# Altium project GTV4.0_Board.PrjPcb (part 8 of 11)

## Sheet Temperature_Sense_Section.SchDoc
size 420 x 297 mm; DocumentNumber: 15; SheetNumber: 15; SheetTotal: 17
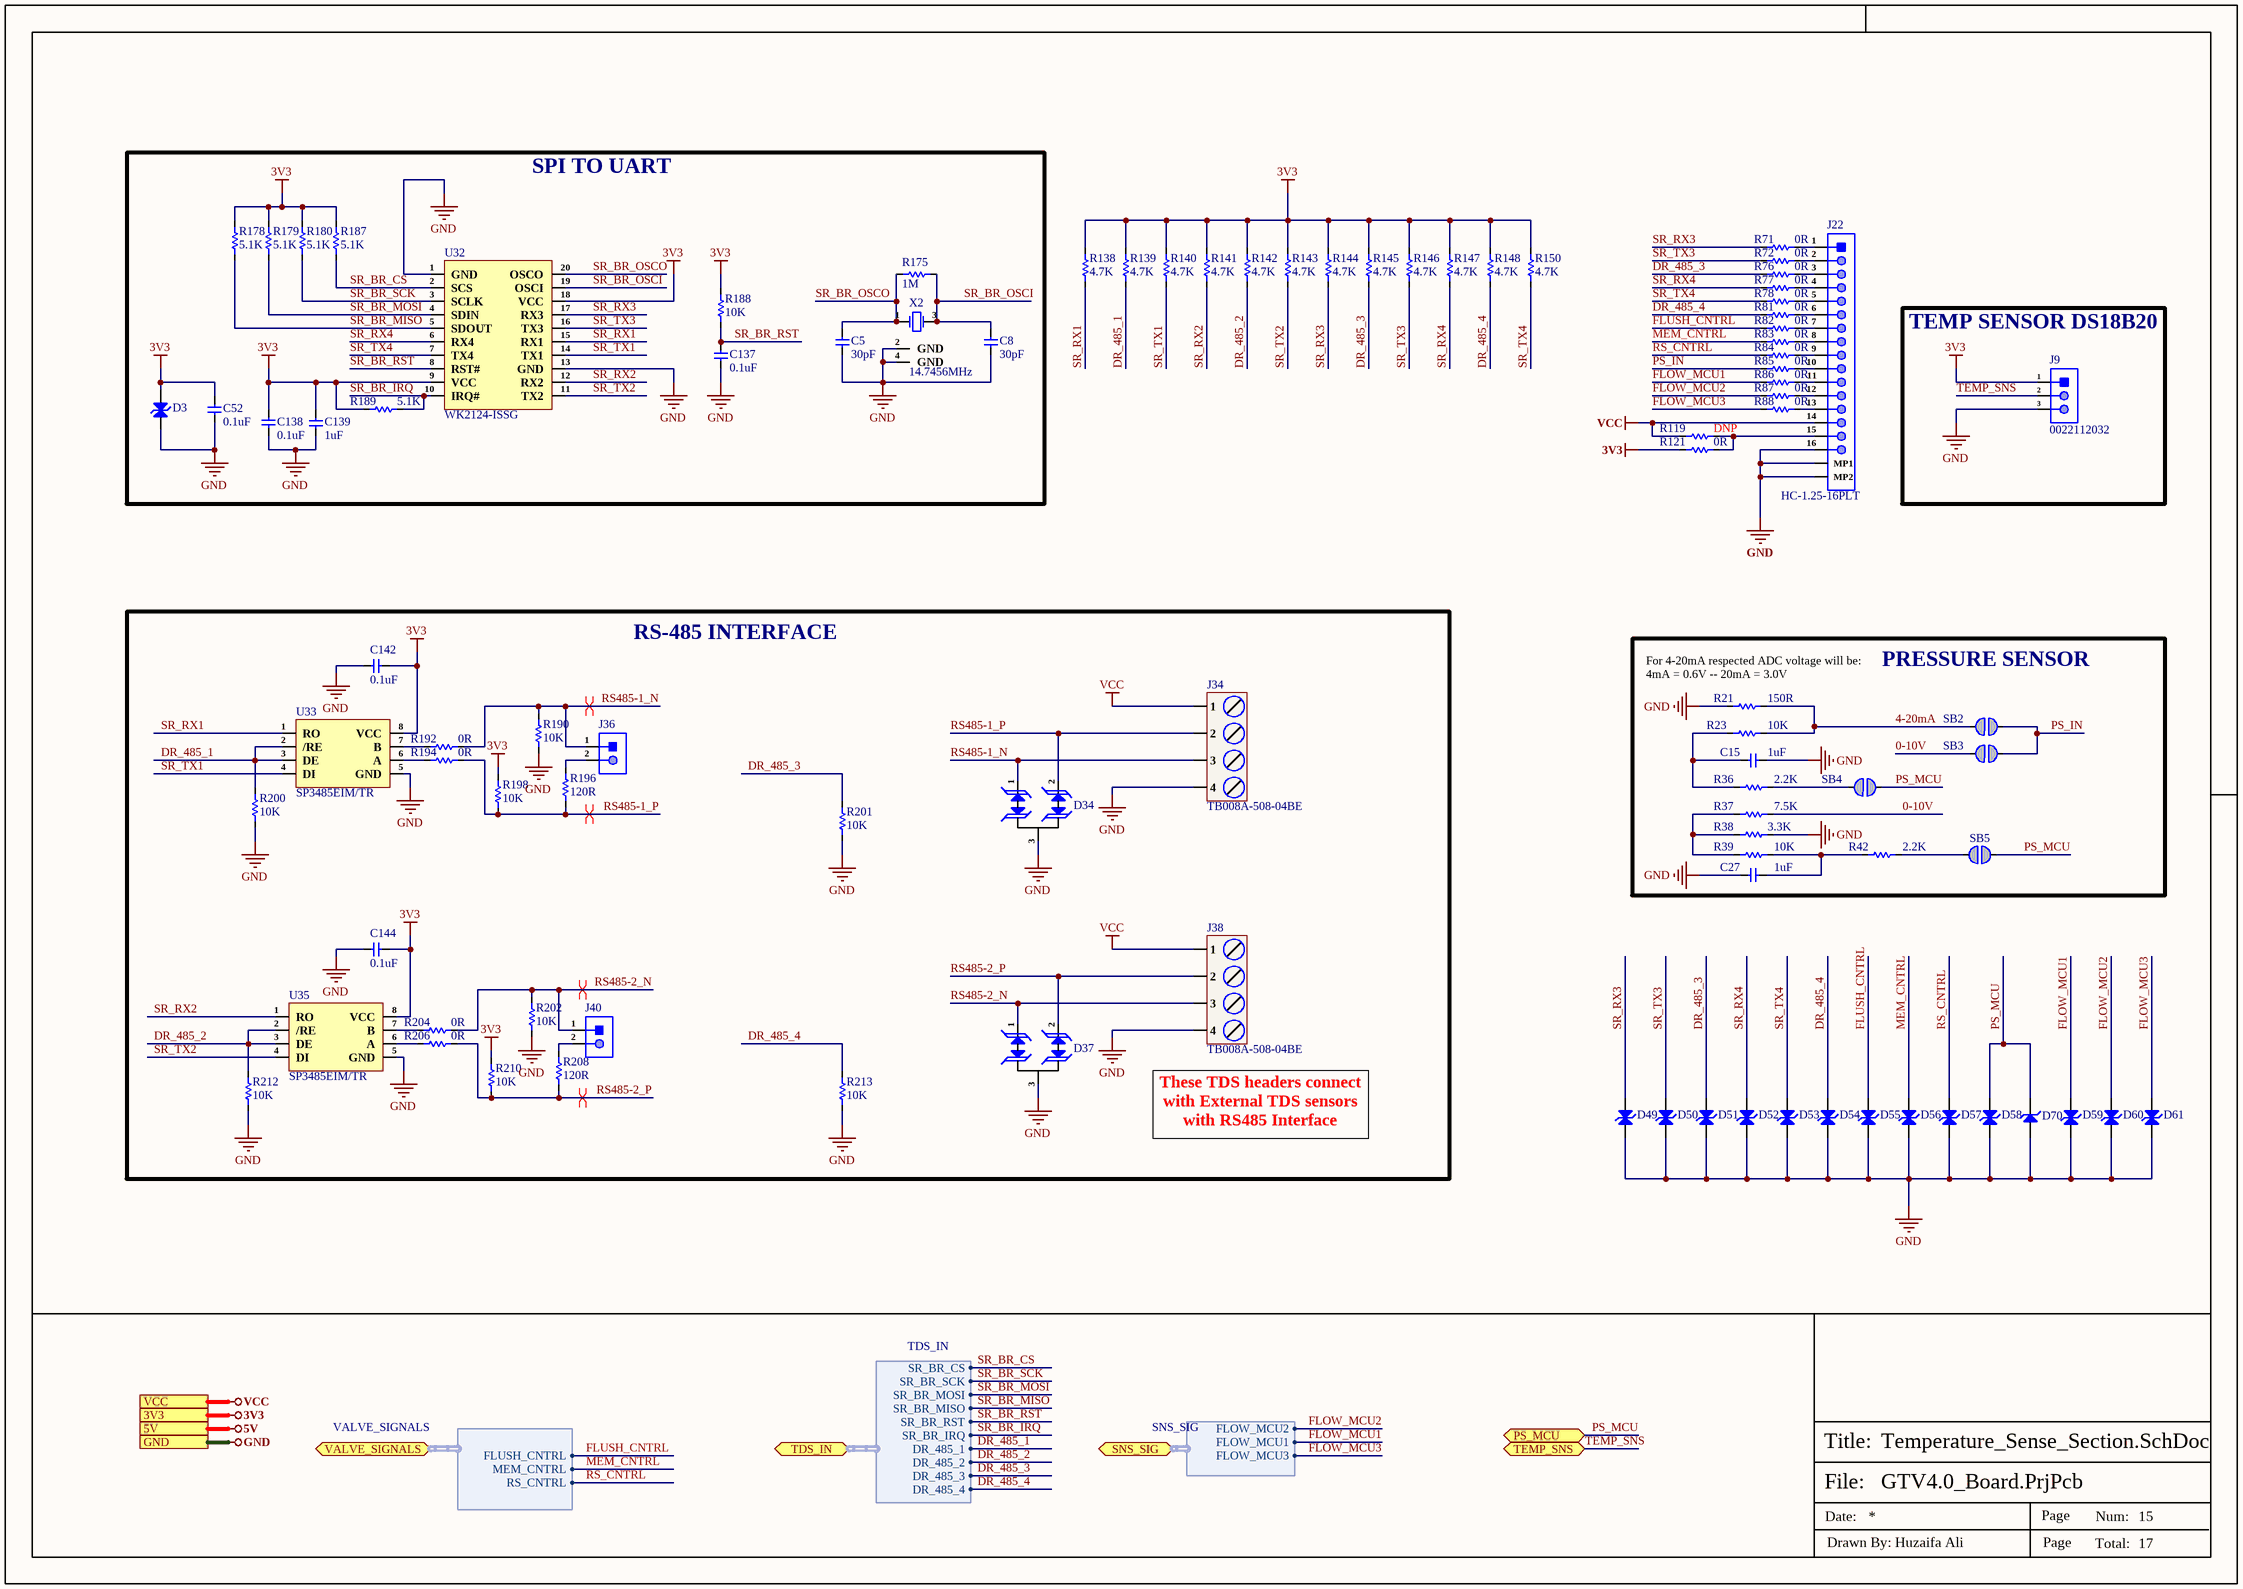
[diagram p13: Temperature_Sense_Section.SchDoc]

### Parts
C5  30pF  [Cap-0402]
C8  30pF  [Cap-0402]
C15  1uF  [Cap-0603]
C27  1uF  [Cap-0603]
C52  0.1uF  [Cap-0603]
C137  0.1uF  [Cap-0402]
C138  0.1uF  [Cap-0402]
C139  1uF  [Cap-0402]
C142  0.1uF  [Cap-0402]
C144  0.1uF  [Cap-0402]
D3  SMAJ5.0CA  [SMA Bi Directional]  (value not drawn)
D34  SM712  [SOT-23]  (value not drawn)
D37  SM712  [SOT-23]  (value not drawn)
D49  LESD8D3.3CAT5G  [SOD-882 Bi Directional]  (value not drawn)
D50  LESD8D3.3CAT5G  [SOD-882 Bi Directional]  (value not drawn)
D51  LESD8D3.3CAT5G  [SOD-882 Bi Directional]  (value not drawn)
D52  LESD8D3.3CAT5G  [SOD-882 Bi Directional]  (value not drawn)
D53  LESD8D3.3CAT5G  [SOD-882 Bi Directional]  (value not drawn)
D54  LESD8D3.3CAT5G  [SOD-882 Bi Directional]  (value not drawn)
D55  LESD8D3.3CAT5G  [SOD-882 Bi Directional]  (value not drawn)
D56  LESD8D3.3CAT5G  [SOD-882 Bi Directional]  (value not drawn)
D57  LESD8D3.3CAT5G  [SOD-882 Bi Directional]  (value not drawn)
D58  LESD8D3.3CAT5G  [SOD-882 Bi Directional]  (value not drawn)
D59  LESD8D3.3CAT5G  [SOD-882 Bi Directional]  (value not drawn)
D60  LESD8D3.3CAT5G  [SOD-882 Bi Directional]  (value not drawn)
D61  LESD8D3.3CAT5G  [SOD-882 Bi Directional]  (value not drawn)
D70  MM3Z3V3B  [SOD323F]  (value not drawn)
J9  0022112032  [0022112032]
J22  HC-1.25-16PLT  [HC-1.25-16PLT]
J34  TB008A-508-04BE  [TB008A-508-04BE]
J36  X6511WV-02H-C60D30  [HDR1X2_]  (value not drawn)
J38  TB008A-508-04BE  [TB008A-508-04BE]
J40  X6511WV-02H-C60D30  [HDR1X2_]  (value not drawn)
R21  150R  [Res-0603]
R23  10K  [Res-0603]
R36  2.2K  [Res-0603]
R37  7.5K  [Res-0603]
R38  3.3K  [Res-0603]
R39  10K  [Res-0603]
R42  2.2K  [Res-0603]
R71  0R  [Res-0603]
R72  0R  [Res-0603]
R76  0R  [Res-0603]
R77  0R  [Res-0603]
R78  0R  [Res-0603]
R81  0R  [Res-0603]
R82  0R  [Res-0603]
R83  0R  [Res-0603]
R84  0R  [Res-0603]
R85  0R  [Res-0603]
R86  0R  [Res-0603]
R87  0R  [Res-0603]
R88  0R  [Res-0603]
R119  DNP  [Res-1206]
R121  0R  [Res-1206]
R138  4.7K  [Res-0402]
R139  4.7K  [Res-0402]
R140  4.7K  [Res-0402]
R141  4.7K  [Res-0402]
R142  4.7K  [Res-0402]
R143  4.7K  [Res-0402]
R144  4.7K  [Res-0402]
R145  4.7K  [Res-0402]
R146  4.7K  [Res-0402]
R147  4.7K  [Res-0402]
R148  4.7K  [Res-0402]
R150  4.7K  [Res-0402]
R175  1M  [Res-0402]
R178  5.1K  [Res-0402]
R179  5.1K  [Res-0402]
R180  5.1K  [Res-0402]
R187  5.1K  [Res-0402]
R188  10K  [Res-0402]
R189  5.1K  [Res-0402]
R190  10K  [Res-0402]
R192  0R  [Res-0402]
R194  0R  [Res-0402]
R196  120R  [Res-0603]
R198  10K  [Res-0402]
R200  10K  [Res-0402]
R201  10K  [Res-0402]
R202  10K  [Res-0402]
R204  0R  [Res-0402]
R206  0R  [Res-0402]
R208  120R  [Res-0603]
R210  10K  [Res-0402]
R212  10K  [Res-0402]
R213  10K  [Res-0402]
SB2  Solder Bridge 0603  [Solder Bridge]  (value not drawn)  (no BOM)
SB3  Solder Bridge 0603  [Solder Bridge]  (value not drawn)  (no BOM)
SB4  Solder Bridge 0603  [Solder Bridge]  (value not drawn)  (no BOM)
SB5  Solder Bridge 0603  [Solder Bridge]  (value not drawn)  (no BOM)
U32  WK2124-ISSG  [SSOP-20-208mil]
U33  SP3485EIM/TR  [SOP-8]
U35  SP3485EIM/TR  [SOP-8]
X2  14.7456MHz  [SMD3225-4P]

### Blocks framed on the sheet
SPI TO UART: C5 C8 C52 C137-C139 D3 R175 R178-R180 R187-R189 U32 X2
TEMP SENSOR DS18B20: J9
RS-485 INTERFACE: C142 C144 D34 D37 J34 J36 J38 J40 R190 R192 R194 R196 R198 R200-R202 R204 R206 R208 R210 R212 R213 U33 U35
PRESSURE SENSOR: C15 C27 R21 R23 R36-R39 R42 SB2-SB5

### Ports
3V3, 5V, GND, PS_MCU (bidir), SNS_SIG (bidir, harness SNS_SIG), TDS_IN (bidir, harness TDS_IN), TEMP_SNS (bidir), VALVE_SIGNALS (bidir, harness VALVE_SIGNALS), VCC

### Harnesses
TDS_IN: SR_BR_RST, SR_BR_IRQ, DR_485_1, DR_485_2, SR_BR_CS, SR_BR_SCK, SR_BR_MOSI, SR_BR_MISO, DR_485_3, DR_485_4
SNS_SIG: FLOW_MCU1, FLOW_MCU2, FLOW_MCU3
VALVE_SIGNALS: FLUSH_CNTRL, MEM_CNTRL, RS_CNTRL

### Nets
3V3: C52.2 C138.1 C139.2 C142.2 C144.2 D3.2(K) J9.1 R121.1 R138.2 R139.2 R140.2 R141.2 R142.2 R143.2 R144.2 R145.2 R146.2 R147.2 R148.2 R150.2 R178.2 R179.2 R180.2 R187.2 R188.2 R189.2 R198.1 R210.1 U32.9(VCC) U32.18(VCC) U33.8(VCC) U35.8(VCC) ; port 3V3
GND: C5.1 C8.1 C15.2 C27.1 C52.1 C137.1 C138.2 C139.1 C142.1 C144.1 D3.1(A) D34.3(GND) D37.3(GND) D49.1(A) D50.1(A) D51.1(A) D52.1(A) D53.1(A) D54.1(A) D55.1(A) D56.1(A) D57.1(A) D58.1(A) D59.1(A) D60.1(A) D61.1(A) D70.1(A) J9.3 J22.16 J22.MP1 J22.MP2 J34.4 J38.4 R21.1 R38.2 R190.2 R200.2 R201.2 R202.2 R212.2 R213.2 U32.1(GND) U32.13(GND) U33.5(GND) U35.5(GND) X2.2(GND) X2.4(GND) ; port GND
VCC: J22.14 J34.1 J38.1 R119.1 ; port VCC
0-10V: R37.2 SB3.2
4-20mA: R21.2 R23.2 SB2.2
DR_485_1: R139.1 R200.1 U33.2(/RE) U33.3(DE) ; port TDS_IN.DR_485_1
DR_485_2: R142.1 R212.1 U35.2(/RE) U35.3(DE) ; port TDS_IN.DR_485_2
DR_485_3: D51.2(A) R76.1 R145.1 R201.1 ; port TDS_IN.DR_485_3
DR_485_4: D54.2(A) R81.1 R148.1 R213.1 ; port TDS_IN.DR_485_4
FLOW_MCU1: D59.2(A) R86.1 ; port SNS_SIG.FLOW_MCU1
FLOW_MCU2: D60.2(A) R87.1 ; port SNS_SIG.FLOW_MCU2
FLOW_MCU3: D61.2(A) R88.1 ; port SNS_SIG.FLOW_MCU3
FLUSH_CNTRL: D55.2(A) R82.1 ; port VALVE_SIGNALS.FLUSH_CNTRL
MEM_CNTRL: D56.2(A) R83.1 ; port VALVE_SIGNALS.MEM_CNTRL
PS_IN: R85.1 SB2.1 SB3.1
PS_MCU: D58.2(A) D70.2(K) SB4.1 SB5.1 ; port PS_MCU
RS485-1_N: D34.1(I/O1) J34.3 J36.1 R190.1 R192.2
RS485-1_P: D34.2(I/O2) J34.2 R194.2 R196.1 R198.2
RS485-2_N: D37.1(I/O1) J38.3 J40.1 R202.1 R204.2
RS485-2_P: D37.2(I/O2) J38.2 R206.2 R208.1 R210.2
RS_CNTRL: D57.2(A) R84.1 ; port VALVE_SIGNALS.RS_CNTRL
SR_BR_CS: R187.1 U32.2(SCS) ; port TDS_IN.SR_BR_CS
SR_BR_IRQ: R189.1 U32.10(IRQ#) ; port TDS_IN.SR_BR_IRQ
SR_BR_MISO: R178.1 U32.5(SDOUT) ; port TDS_IN.SR_BR_MISO
SR_BR_MOSI: R179.1 U32.4(SDIN) ; port TDS_IN.SR_BR_MOSI
SR_BR_OSCI: C8.2 R175.2 U32.19(OSCI) X2.3(OSC2)
SR_BR_OSCO: C5.2 R175.1 U32.20(OSCO) X2.1(OSC1)
SR_BR_RST: C137.2 R188.1 U32.8(RST#) ; port TDS_IN.SR_BR_RST
SR_BR_SCK: R180.1 U32.3(SCLK) ; port TDS_IN.SR_BR_SCK
SR_RX1: R138.1 U32.15(RX1) U33.1(RO)
SR_RX2: R141.1 U32.12(RX2) U35.1(RO)
SR_RX3: D49.2(A) R71.1 R144.1 U32.17(RX3)
SR_RX4: D52.2(A) R77.1 R147.1 U32.6(RX4)
SR_TX1: R140.1 U32.14(TX1) U33.4(DI)
SR_TX2: R143.1 U32.11(TX2) U35.4(DI)
SR_TX3: D50.2(A) R72.1 R146.1 U32.16(TX3)
SR_TX4: D53.2(A) R78.1 R150.1 U32.7(TX4)
TEMP_SNS: J9.2 ; port TEMP_SNS
NetC15_1: C15.1 R23.1 R36.1
NetC27_2: C27.2 R39.2 R42.1
NetJ22_1: J22.1 R71.2
NetJ22_2: J22.2 R72.2
NetJ22_3: J22.3 R76.2
NetJ22_4: J22.4 R77.2
NetJ22_5: J22.5 R78.2
NetJ22_6: J22.6 R81.2
NetJ22_7: J22.7 R82.2
NetJ22_8: J22.8 R83.2
NetJ22_9: J22.9 R84.2
NetJ22_10: J22.10 R85.2
NetJ22_11: J22.11 R86.2
NetJ22_12: J22.12 R87.2
NetJ22_13: J22.13 R88.2
NetJ22_15: J22.15 R119.2 R121.2
NetJ36_2: J36.2 R196.2
NetJ40_2: J40.2 R208.2
NetR36_2: R36.2 SB4.2
NetR37_1: R37.1 R38.1 R39.1
NetR42_2: R42.2 SB5.2
NetR192_1: R192.1 U33.7(B)
NetR194_1: R194.1 U33.6(A)
NetR204_1: R204.1 U35.7(B)
NetR206_1: R206.1 U35.6(A)

### Layout directives
differential pair: RS485-1_N, RS485-1_P, RS485-2_N, RS485-2_P

### Notes on the sheet
- (near R21) For 4-20mA respected ADC voltage will be:
  4mA = 0.6V -- 20mA = 3.0V
- (near J38) These TDS headers connect with External TDS sensors with RS485 Interface
- File:
- Title:
- Date:
- Page
- Num:
- Total:
- Drawn By: Huzaifa Ali

### Library data of the parts
C5 C8 = CC0402GRNPO9BN300: CAP CER 30PF 50V C0G/NPO 0402; Manufacturer: Yageo; Item Type: Capacitor; Tolerance: 2%; Dielectric: C0G; Supplier: Digikey; LCSC Part Number: C277479; Manufacturer Part Number: CC0402GRNPO9BN300; RoHS: Yes; Stock: 114930; Pricing: 1=0.1, 10=0.052, 50=0.0296, 100=0.023, 500=0.01728, 1000=0.01358, 2500=0.01235, 5000=0.01136 (USD); Mounting Technology: Surface Mount; Case/Package: 0402; Case Code (Imperial): 0402; Case Code (Metric): 1005; Weight: 2.3E-05oz; Min Operating Temperature: -55°C; Max Operating Temperature: 125°C; Value: 30pF; Voltage Rating (DC): 50V; Packaging: Tape and Reel; Termination: SMD/SMT; Voltage Rating: 50V; Series: CC; Length: 0.039inch; Width: 0.02inch; Thickness: 0.022inch; Halogen Free: 5694HalogenFree; Lead Free: 5697LeadFree; ComponentLink1URL: https://datasheet.ciiva.com/13263/upy-gp-np0-16v-to-50v-8-3714-13263350.pdf?src-supplier=Mouser; ComponentLink1Description: https://datasheet.ciiva.com/13263/upy-gp-np0-16v-to-50v-8-3714-13263350.pdf?src-supplier=Mouser
C15 C27 = CC0603KRX5R8BB105: CAP CER 1UF 25V X5R 0603; Manufacturer: Yageo; Tolerance: 10%; Item Type: Capacitor; Supplier 1: Digi-Key; Manufacturer Part Number: CC0603KRX5R8BB105; RoHS: Yes; Category: Ceramic Capacitors; Stock 1: 919939; Pricing 1: 1=0.12000, 10=0.08400, 50=0.04760, 100=0.03940, 500=0.02764, 1000=0.02288 (USD); Mount: Surface Mount; Case/Package: 0603; Number of Pins: 2; Case Code (Metric): 1608; Case Code (Imperial): 0603; Min Operating Temperature: -55°C; Max Operating Temperature: 85°C; Capacitance: 1uF; Dielectric: X5R; Package Quantity: 1; Voltage Rating: 25V; Packaging: Tape and Reel; Termination: SMD/SMT; Voltage Rating (DC): 25V; Series: CC; Construction: Flat; Length: 1.6mm; Width: 0.031inch; Height: 0.8mm; Thickness: 0.035inch; Depth: 0.8mm; Radiation Hardening: No; REACH SVHC: No SVHC; Lead Free: Lead Free; Halogen Free: Halogen Free; RoHS Compliant: Yes; ComponentLink1URL: https://datasheet.ciiva.com/176/mlccorderingcode-176785.pdf?src-supplier=Digi-Key; ComponentLink1Description: https://datasheet.ciiva.com/176/mlccorderingcode-176785.pdf?src-supplier=Digi-Key; ComponentLink2URL: https://datasheet.ciiva.com/176/mlccorderingcode-176786.pdf?src-supplier=Digi-Key; ComponentLink2Description: https://datasheet.ciiva.com/176/mlccorderingcode-176786.pdf?src-supplier=Digi-Key; ComponentLink3URL: https://datasheet.ciiva.com/176/mlccorderingcode-176787.pdf?src-supplier=Digi-Key; ComponentLink3Description: https://datasheet.ciiva.com/176/mlccorderingcode-176787.pdf?src-supplier=Digi-Key; ComponentLink4URL: https://datasheet.ciiva.com/17436/upy-gphc-x5r-4v-to-50v-12-17436952.pdf?src-supplier=Avnet+Europe; ComponentLink4Description: https://datasheet.ciiva.com/17436/upy-gphc-x5r-4v-to-50v-12-17436952.pdf?src-supplier=Avnet+Europe; ComponentLink5URL: https://datasheet.ciiva.com/7978/1525783-7978171.pdf?src-supplier=Element14; ComponentLink5Description: https://datasheet.ciiva.com/7978/1525783-7978171.pdf?src-supplier=Element14; ComponentLink6URL: https://datasheet.ciiva.com/11586/upy-gphc-x5r-4v-to-50v-12-11586318.pdf?src-supplier=Avnet; ComponentLink6Description: https://datasheet.ciiva.com/11586/upy-gphc-x5r-4v-to-50v-12-11586318.pdf?src-supplier=Avnet; Supplier Part Number 1: 311-1445-1-ND; LCSC Part Number: C14664
C52 = CC0603ZRY5V9BB104: as C69 on sheet WIFI_Display_Sheet; Supplier 1: Digi-Key; Manufacturer Part Number: CC0603ZRY5V9BB104; Stock 1: 15000880; Pricing 1: 1=0.1, 10=0.075, 100=0.0334, 500=0.02386, 1000=0.01874 (USD); Mount: Surface Mount; Case/Package: 0603; Number of Pins: 2; Case Code (Metric): 1608; Case Code (Imperial): 0603; Min Operating Temperature: -30°C; Max Operating Temperature: 85°C; Dielectric: Y5V; Voltage Rating: 50V; Package Quantity: 1; Packaging: Tape and Reel; Voltage Rating (DC): 50V; Termination: SMD/SMT; Composition: Ceramic; Voltage: 50V; Length: 1.6mm; Height: 0.8mm; Width: 0.031inch; Thickness: 0.035inch; Depth: 0.8mm; Radiation Hardening: No; REACH SVHC: No SVHC; Lead Free: Lead Free; Halogen Free: Halogen Free; ComponentLink1URL: http://www.yageo.com/documents/recent/UPY-GPHC_Y5V_6.3V-to-50V_8.pdf?src-supplier=Digi-Key; ComponentLink1Description: http://www.yageo.com/documents/recent/UPY-GPHC_Y5V_6.3V-to-50V_8.pdf?src-supplier=Digi-Key; ComponentLink2URL: http://www.yageo.com/documents/recent/UPY-GPHC_Y5V_6.3V-to-50V_5.pdf?src-supplier=Avnet+Europe; ComponentLink2Description: http://www.yageo.com/documents/recent/UPY-GPHC_Y5V_6.3V-to-50V_5.pdf?src-supplier=Avnet+Europe; ComponentLink3URL: https://www.verical.com/server-webapp/html/getDatasheet?partID=403611&src-supplier=Verical; ComponentLink3Description: https://www.verical.com/server-webapp/html/getDatasheet?partID=403611&src-supplier=Verical; ComponentLink4URL: http://www.mouser.com/ds/2/447/Yageo_UPY-GP_NP0_16V-to-50V_9-358835.pdf?src-supplier=Mouser; ComponentLink4Description: http://www.mouser.com/ds/2/447/Yageo_UPY-GP_NP0_16V-to-50V_9-358835.pdf?src-supplier=Mouser; ComponentLink5URL: http://www.farnell.com/datasheets/1132289.pdf?src-supplier=Element14; ComponentLink5Description: http://www.farnell.com/datasheets/1132289.pdf?src-supplier=Element14; Supplier Part Number 1: 311-1343-1-ND; LCSC Part Number: C106221
C137 C138 C142 C144 = CC0402JRX7R7BB104: as C56 on sheet Valve_Section; Supplier: Digikey; Supplier Part Number: 311-1676-1-ND; Manufacturer Part Number: CC0402JRX7R7BB104; RoHS: Yes; Category: Ceramic Capacitors; Stock: 1659111; Pricing: 1=0.1, 10=0.046, 50=0.0262, 100=0.0203, 500=0.01528, 1000=0.012, 2500=0.01091, 5000=0.01004 (USD); Mounting Technology: Surface Mount; Case/Package: 0402; Case Code (Metric): 1005; Case Code (Imperial): 0402; Min Operating Temperature: -55°C; Max Operating Temperature: 125°C; Dielectric: X7R; Packaging: Tape and Reel; Package Quantity: 10000; Voltage Rating (DC): 16V; Voltage Rating: 16V; Series: CC; Construction: Flat; Length: 0.039inch; Width: 0.02inch; Height: 0.5mm; Thickness: 0.022inch; Lead Free: Lead Free; Halogen Free: Halogen Free; RoHS Compliant: Yes; ComponentLink1URL: https://datasheet.ciiva.com/13210/upy-gphc-x7r-6-3v-to-50v-8-12304-13210152.pdf?src-supplier=Mouser; ComponentLink1Description: https://datasheet.ciiva.com/13210/upy-gphc-x7r-6-3v-to-50v-8-12304-13210152.pdf?src-supplier=Mouser; LCSC Part Number: C541464
C139 = CC0402KRX5R7BB105: as C7 on sheet Controller_Section; Supplier 1: Digi-Key; Manufacturer Part Number: CC0402KRX5R7BB105; Stock 1: 1405667; Pricing 1: 1=0.36, 10=0.252, 100=0.1512, 500=0.1134, 1000=0.09576, 2500=0.09072, 5000=0.08568 (USD); Mount: Surface Mount; Case/Package: 0402; Weight: 2.3E-05oz; Case Code (Imperial): 0402; Case Code (Metric): 1005; Min Operating Temperature: -55°C; Max Operating Temperature: 85°C; Capacitance: 1uF; Dielectric: X5R; Packaging: Tape and Reel; Voltage Rating (DC): 16V; Voltage Rating: 16V; Termination: SMD/SMT; Composition: Ceramic; Length: 1mm; Height: 0.5mm; Width: 0.02inch; Thickness: 0.022inch; Depth: 0.5mm; Radiation Hardening: No; Lead Free: Lead Free; Halogen Free: Halogen Free; ComponentLink1URL: http://www.yageo.com/documents/recent/UPY-GPHC_X5R_4V-to-50V_12.pdf?src-supplier=Avnet+Europe; ComponentLink1Description: http://www.yageo.com/documents/recent/UPY-GPHC_X5R_4V-to-50V_12.pdf?src-supplier=Avnet+Europe; Supplier Part Number 1: 311-1691-6-ND; LCSC Part Number: C325464
D3 = SMAJ5.0CA: TVS DIODE 5VWM 9.2VC SMA; Manufacturer: FTR; Manufacturer Part Number: SMAJ5.0CA; Package: SMA(DO-214AC); Item Type: Diode; LCSC Part Number: C693487; ComponentLink1Description: LCSC; ComponentLink1URL: https://www.lcsc.com/product-detail/TVS_GOODWORK-SMAJ5-0CA_C908809.html
D34 D37 = SM712: SOT-23 TVS ROHS; Manufacturer: TECH PUBLIC; Item Type: Diode; Manufacturer Part Number: SM712; Package: SOT-23; LCSC Part Number: C521963; ComponentLink1Description: LCSC; ComponentLink1URL: https://www.lcsc.com/product-detail/TVS_TECH-PUBLIC-SM712_C521963.html
D49-D61 = LESD8D3.3CAT5G: as D20 on sheet SD-Card-Sheet; Manufacturer Part Number: LESD8D3.3CAT5G; Package: SOD-882; LCSC Part Number: C172409; Item Type: Protection Device; ComponentLink1Description: LCSC; ComponentLink1URL: https://www.lcsc.com/product-detail/span-style-background-color-ff0-ESD-span-Protection-Devices_LRC-LESD8D3-3CAT5G_C172409.html
D70 = MM3Z3V3B: as D5 on sheet Controller_Section; Supplier 1: Digi-Key; Manufacturer Part Number: MM3Z3V3B; Stock 1: 473644; Pricing 1: 1=0.22, 10=0.18, 100=0.0956, 500=0.06288, 1000=0.04276 (USD); Mount: Surface Mount; Number of Pins: 2; Weight: 0.0276g; Min Operating Temperature: -65°C; Max Operating Temperature: 150°C; Packaging: Tape and Reel; Package Quantity: 1; Max Power Dissipation: 200mW; Zener Voltage: 3.3V; Voltage Tolerance: 2%; Power Dissipation: 200mW; Working Voltage: 3.3V; Peak Reverse Current: 4.5uA; Length: 1.3mm; Height: 1mm; Width: 1.7mm; Radiation Hardening: No; REACH SVHC: No SVHC; Lead Free: Lead Free; ComponentLink1URL: http://www.onsemi.com/pub/Collateral/MM3Z9V1B-D.pdf?src-supplier=Digi-Key; ComponentLink1Description: http://www.onsemi.com/pub/Collateral/MM3Z9V1B-D.pdf?src-supplier=Digi-Key; ComponentLink2URL: http://www.mouser.com/ds/2/149/MM3Z3V3B-187166.pdf?src-supplier=Mouser; ComponentLink2Description: http://www.mouser.com/ds/2/149/MM3Z3V3B-187166.pdf?src-supplier=Mouser; ComponentLink3URL: https://www.fairchildsemi.com/datasheets/MM/MM3Z9V1B.pdf?src-supplier=Avnet; ComponentLink3Description: https://www.fairchildsemi.com/datasheets/MM/MM3Z9V1B.pdf?src-supplier=Avnet; ComponentLink4URL: http://www.farnell.com/datasheets/1706525.pdf?src-supplier=Element14; ComponentLink4Description: http://www.farnell.com/datasheets/1706525.pdf?src-supplier=Element14; Supplier Part Number 1: MM3Z3V3BCT-ND; LCSC Part Number: C2978865; Item Type: Diode
J9 = 0022112032: CONN HEADER VERT 3POS 2.54MM; Manufacturer: Molex; Item Type: Headers, Male Pins; Supplier: Mouser; Supplier Part Number: 538-22-11-2032; Manufacturer Part Number: 0022112032; RoHS: Yes; Stock: 32037; Pricing: 1=0.68, 10=0.599, 50=0.599, 100=0.494, 1000=0.354, 10000=0.311 (USD); ComponentLink1URL: https://www.molex.com/pdm_docs/sd/022112032_sd.pdf?src-supplier=Digikey; ComponentLink1Description: https://www.molex.com/pdm_docs/sd/022112032_sd.pdf?src-supplier=Digikey; LCSC Part Number: C505163
J22 = HC-1.25-16PLT: 1x16P PicoBlade(MX 1.25) 16P Tin 16 -25℃~+85℃ 2A 1 1.25mm Brass Surface Mount,Vertical SMD,P=1.25mm Wire To Board Connector ROHS; Manufacturer: HCTL; Manufacturer Part Number: HC-1.25-16PLT; Package: SMD,P=1.25mm; LCSC Part Number: C3012301; Item Type: Wire To Board Connector; ComponentLink1Description: LCSC; ComponentLink1URL: https://lcsc.com/product-detail/Wire-To-Board-Connector_HCTL-HC-1-25-16PLT_C3012301.html?s_z=n_HC-1.25-16PLT
J34 J38 = TB008A-508-04BE: TERMINAL BLOCK, SCREW TYPE, 5.08; Manufacturer: Same Sky; Item Type: Terminal Blocks; Approvals: CE, IEC, UL, cUL; Current Rating: 16A; Number of Contacts: 4; Number of Levels: 1; Pitch: 5.08mm; Voltage Rating: 300V; Wire/Cable Gauge: 12AWG; Supplier: DigiKey; Supplier Part Number: 102-6215-ND; Manufacturer Part Number: TB008A-508-04BE; RoHS: Compliant; Stock: 5628; Pricing: 1=1.14, 10=0.833, 25=0.7248, 50=0.654, 100=0.5931, 250=0.52748, 600=0.47917, 1200=0.4494, 5400=0.40466 (USD); Color: Blue; Height: 15.82mm; Lifecycle Status: Production; Max Operating Temperature: 105°C; Min Operating Temperature: -40°C; Mounting Technology: Screw; Number of Rows: 1; Width: 13.89mm; ComponentLink1URL: https://datasheet.octopart.com:443/TB008A-508-04BE-Same-Sky-datasheet-181920260.pdf?src-supplier=Same+Sky; ComponentLink1Description: https://datasheet.octopart.com:443/TB008A-508-04BE-Same-Sky-datasheet-181920260.pdf?src-supplier=Same+Sky; ComponentLink2URL: https://datasheet.octopart.com:443/TB008A-508-04BE-CUI-Devices-datasheet-175928141.pdf?src-supplier=Same+Sky; ComponentLink2Description: https://datasheet.octopart.com:443/TB008A-508-04BE-CUI-Devices-datasheet-175928141.pdf?src-supplier=Same+Sky; ComponentLink3URL: https://datasheet.octopart.com:443/TB008A-508-04BE-CUI-Devices-datasheet-144794964.pdf?src-supplier=Same+Sky; ComponentLink3Description: https://datasheet.octopart.com:443/TB008A-508-04BE-CUI-Devices-datasheet-144794964.pdf?src-supplier=Same+Sky; ComponentLink4URL: https://datasheet.octopart.com:443/TB008A-508-04BE-CUI-Devices-datasheet-180438533.pdf?src-supplier=IHS; ComponentLink4Description: https://datasheet.octopart.com:443/TB008A-508-04BE-CUI-Devices-datasheet-180438533.pdf?src-supplier=IHS; ComponentLink5URL: https://datasheet.octopart.com:443/TB008A-508-04BE-Same-Sky-datasheet-182881448.pdf?src-supplier=Electro+Sonic; ComponentLink5Description: https://datasheet.octopart.com:443/TB008A-508-04BE-Same-Sky-datasheet-182881448.pdf?src-supplier=Electro+Sonic; ComponentLink6URL: https://datasheet.octopart.com:443/TB008A-508-04BE-CUI-Devices-datasheet-175927974.pdf?src-supplier=CUI+Devices+SCT; ComponentLink6Description: https://datasheet.octopart.com:443/TB008A-508-04BE-CUI-Devices-datasheet-175927974.pdf?src-supplier=CUI+Devices+SCT; ComponentLink7URL: https://datasheet.octopart.com:443/TB008A-508-04BE-CUI-Devices-datasheet-142371924.pdf?src-supplier=CUI+Devices+SCT; ComponentLink7Description: https://datasheet.octopart.com:443/TB008A-508-04BE-CUI-Devices-datasheet-142371924.pdf?src-supplier=CUI+Devices+SCT; ComponentLink8URL: https://octopart.com:443/opatz8j6/c1?t=hGvcwVFCluaof_F_xfzySJZeS5TbXVjbvjBRKQv-3irzXUzCEiOoxviMhdjRwAb3fOCDVe4c5YGr-0WW8XN3cEfZX5wGS5TsQt0_PkryWK4ovLFNv0kxfacWAuW0ZsoLC1d8PZGzL_RujTsCFKJeixsWFtvWnZHquXYDPWSaMEm2NajHA6hQYmAL5oH5NE5VbXDgyJFupMAl_60Y4gU8_zMBRTNtepsp_uCzaYBmldgpjRQcz_FrhdxgGRUVVYU-GQCk8GR1JA5LP3N_h8JcKCEohvKWuFQD1_k5TrYcqod8vt8FhZbO_j5MOoXA-2FHSBOKuQiqNs835mRvEd7KXZ8_SSnD6XzLcd8eVf8XSQ&src-supplier=Compliance+Statements; ComponentLink8Description: https://octopart.com:443/opatz8j6/c1?t=hGvcwVFCluaof_F_xfzySJZeS5TbXVjbvjBRKQv-3irzXUzCEiOoxviMhdjRwAb3fOCDVe4c5YGr-0WW8XN3cEfZX5wGS5TsQt0_PkryWK4ovLFNv0kxfacWAuW0ZsoLC1d8PZGzL_RujTsCFKJeixsWFtvWnZHquXYDPWSaMEm2NajHA6hQYmAL5oH5NE5VbXDgyJFupMAl_60Y4gU8_zMBRTNtepsp_uCzaYBmldgpjRQcz_FrhdxgGRUVVYU-GQCk8GR1JA5LP3N_h8JcKCEohvKWuFQD1_k5TrYcqod8vt8FhZbO_j5MOoXA-2FHSBOKuQiqNs835mRvEd7KXZ8_SSnD6XzLcd8eVf8XSQ&src-supplier=Compliance+Statements; ComponentLink9URL: https://octopart.com:443/opatz8j6/c1?t=kcSyPpMU4RMF4VpwiQE-vJl8CamqtVbKkLklcOULTBNIjlJlIxbT5UVKofOl15FhQc6Ivmv9LIPZHTHBsEbapZqtFFdTEXS3BvBw3lR-XVowoaKLmyENkRQxW_qAoJFYG0K2AtNOfH4fQoDAbATgRkt9CS-AoJvNW7hVQcq3p1vqSemKtdokDR8cAxYex92iO8_Mk2rTIvg6a28-X5kEZlUiTVepfc-9M2XGm2vN09cF4Wboki8fsU05tXaelQ0ZNRPnjS-McBzlof2dcZyflBQCVo1dNw8uQ3VjkX7PyeDYMoTtW7hf0jd0vfOVEoP87q9SuMHxGCuHptUdsndpROH7GdXMoN4B7g9EMxMunBUwuk4&src-supplier=Compliance+Statements; ComponentLink9Description: https://octopart.com:443/opatz8j6/c1?t=kcSyPpMU4RMF4VpwiQE-vJl8CamqtVbKkLklcOULTBNIjlJlIxbT5UVKofOl15FhQc6Ivmv9LIPZHTHBsEbapZqtFFdTEXS3BvBw3lR-XVowoaKLmyENkRQxW_qAoJFYG0K2AtNOfH4fQoDAbATgRkt9CS-AoJvNW7hVQcq3p1vqSemKtdokDR8cAxYex92iO8_Mk2rTIvg6a28-X5kEZlUiTVepfc-9M2XGm2vN09cF4Wboki8fsU05tXaelQ0ZNRPnjS-McBzlof2dcZyflBQCVo1dNw8uQ3VjkX7PyeDYMoTtW7hf0jd0vfOVEoP87q9SuMHxGCuHptUdsndpROH7GdXMoN4B7g9EMxMunBUwuk4&src-supplier=Compliance+Statements; ComponentLink10URL: https://octopart.com:443/opatz8j6/c1?t=l6hRGZkTByDfJKP0wjoChujQdUe10jMusc-_a500HSGKN_CBApmvAkO6R9Z66QIZAkxJwrS_e77arXYN0D4KMAQY6kf5trjTt7cbNbXdJ19-jX2xdgBJNHgQ5piJwMQy0j1cjvOnscxRAEVTRujX-MIpC9afUxDNR6j8ZshfBKCtAhxZsuMdKJaRyfNFgz62X5UOXHxW2F9FO61bSliYNKc_gyYtpwMs8OBLVBvRIN39Pxv0hFbPaaBzQoOyZmcaapE2_AliUpkUpVlcqFwL0AIe6zxyatQvYXWCrfe_hkJarxpJgGXX8YhKbFMoTHVKEjQfhWh6dOEaufH6As1HmOljMZjV1NUMWRYwWsY_3w&src-supplier=Compliance+Statements; ComponentLink10Description: https://octopart.com:443/opatz8j6/c1?t=l6hRGZkTByDfJKP0wjoChujQdUe10jMusc-_a500HSGKN_CBApmvAkO6R9Z66QIZAkxJwrS_e77arXYN0D4KMAQY6kf5trjTt7cbNbXdJ19-jX2xdgBJNHgQ5piJwMQy0j1cjvOnscxRAEVTRujX-MIpC9afUxDNR6j8ZshfBKCtAhxZsuMdKJaRyfNFgz62X5UOXHxW2F9FO61bSliYNKc_gyYtpwMs8OBLVBvRIN39Pxv0hFbPaaBzQoOyZmcaapE2_AliUpkUpVlcqFwL0AIe6zxyatQvYXWCrfe_hkJarxpJgGXX8YhKbFMoTHVKEjQfhWh6dOEaufH6As1HmOljMZjV1NUMWRYwWsY_3w&src-supplier=Compliance+Statements; ComponentLink11URL: https://octopart.com:443/opatz8j6/c1?t=GIq7aDdChJgHFYgeLx6bK2fnpsa8yHt5NBD6UzpxNhj-JGjs7cwjJzyJXx8qUNkt4CyAB53dWU77ZJb9LS3HFvWpfMUSXGIsO1beyBdTid9q8slGEYu7IBIewf0GnxynNkDOZXgKYLk3NKuccprZ30RSHLrF0NVQza7GgcHR9xha1J9gFkNwhZbFB7CZZEh_u0FYvLWhSGSW0KKMrlJv3yGYqQGUZplbJUXnuDQHhDQeYzl7ZWMt3PZlLfjF-dG7gJAcYTZln9WiR7fcYTm6nTF1klQUs_EhcdgQ3j1iRrIGJdpONymccdurqN94YjpYwxiqo2CenTd-fgklSWPjb5fiprlTST3oZF7xVWcdLvwV1ek&src-supplier=Compliance+Statements; ComponentLink11Description: https://octopart.com:443/opatz8j6/c1?t=GIq7aDdChJgHFYgeLx6bK2fnpsa8yHt5NBD6UzpxNhj-JGjs7cwjJzyJXx8qUNkt4CyAB53dWU77ZJb9LS3HFvWpfMUSXGIsO1beyBdTid9q8slGEYu7IBIewf0GnxynNkDOZXgKYLk3NKuccprZ30RSHLrF0NVQza7GgcHR9xha1J9gFkNwhZbFB7CZZEh_u0FYvLWhSGSW0KKMrlJv3yGYqQGUZplbJUXnuDQHhDQeYzl7ZWMt3PZlLfjF-dG7gJAcYTZln9WiR7fcYTm6nTF1klQUs_EhcdgQ3j1iRrIGJdpONymccdurqN94YjpYwxiqo2CenTd-fgklSWPjb5fiprlTST3oZF7xVWcdLvwV1ek&src-supplier=Compliance+Statements
J36 J40 = X6511WV-02H-C60D30: Gold 250V 3A Straight Square Pins 2.5mm 2P 260℃ 6mm -40℃~+105℃ 3mm 2.54mm Plugin Black Brass 1x2P Plugin,P=2.54mm Pin Headers ROHS; Manufacturer: XKB; Item Type: Male Header; Manufacturer Part Number: X6511WV-02H-C60D30; Package: Plugin,P=2.54mm; LCSC Part Number: C706874; ComponentLink1Description: LCSC; ComponentLink1URL: https://www.lcsc.com/product-detail/Pin-Headers_XKB-Connectivity-X6511WV-02H-C60D30_C706874.html
R21 = RC0603DR-07150RL: RES 150 OHM 0.5% 1/10W 0603; Manufacturer: Yageo; Max Power Dissipation: 100mW; Temperature Coefficient: 100ppm/°C; Item Type: Resistor; Supplier 1: Avnet; Manufacturer Part Number: RC0603DR-07150RL; RoHS: Yes; Category: Chip SMD Resistors; Pricing 1: 5000=0.00430, 10000=0.00424, 20000=0.00411 (USD); Case/Package: 0603; Min Operating Temperature: -55°C; Max Operating Temperature: 155°C; Packaging: Tape and Reel; Resistance: 150R; Resistor Type: Thick Film; Number of Terminations: 2; Tolerance: 0.5%; Features: Moisture Resistant; Length: 0.063inch; Width: 0.031inch; Height: 0.022inch; RoHS Compliant: Yes; ComponentLink1URL: http://www.yageo.com.tw/exep/pages/download/literatures/PYu-R_INT-thick_7.pdf?src-supplier=Digi-Key; ComponentLink1Description: http://www.yageo.com.tw/exep/pages/download/literatures/PYu-R_INT-thick_7.pdf?src-supplier=Digi-Key; Supplier Part Number 1: RC0603DR-07150RL; LCSC Part Number: C471801
R23 R39 = RC0603FR-0710KL: RES SMD 10K Ohm 1% 1/10W 0603; Manufacturer: Yageo; Resistance: 10kR; Temperature Coefficient: 100ppm/°C; Voltage Rating (DC): 50V; Power Rating: 100mW; Voltage Rating: 75V; Item Type: Resistor; Supplier 1: Digi-Key; Manufacturer Part Number: RC0603FR-0710KL; RoHS: Yes; Category: Chip SMD Resistors; Stock 1: 25249139; Pricing 1: 1=0.10000, 10=0.02400, 100=0.00970, 1000=0.00436, 2500=0.00378 (USD); Case/Package: 0603; Number of Pins: 2; Case Code (Imperial): 0603; Case Code (Metric): 1608; Weight: 7.1E-05oz; Size Code: 0603; Min Operating Temperature: -55°C; Max Operating Temperature: 155°C; Tolerance: 1%; Resistor Type: Thick Film; Packaging: Tape and Reel; Termination: SMD/SMT; Features: Moisture Resistant; Series: RC; Max Power Dissipation: 100mW; Number of Terminations: 2; Resistance Tolerance: 1%; Construction: Rectangular; Length: 1.6mm; Width: 0.8mm; Height: 0.45mm; Depth: 0.8mm; Lead Pitch: 0.3mm; REACH SVHC: Unknown; Lead Free: Lead Free; Military Standard: Not; RoHS Compliant: Yes; ComponentLink1URL: https://datasheet.ciiva.com/7660/38590-7660789.pdf?src-supplier=Element14; ComponentLink1Description: https://datasheet.ciiva.com/7660/38590-7660789.pdf?src-supplier=Element14; ComponentLink2URL: https://datasheet.ciiva.com/7983/443971-7983596.pdf?src-supplier=Element14; ComponentLink2Description: https://datasheet.ciiva.com/7983/443971-7983596.pdf?src-supplier=Element14; ComponentLink3URL: https://datasheet.ciiva.com/22747/443971-22747519.pdf?src-supplier=Element14; ComponentLink3Description: https://datasheet.ciiva.com/22747/443971-22747519.pdf?src-supplier=Element14; ComponentLink4URL: https://datasheet.ciiva.com/46440/1868787-46440891.pdf?src-supplier=Element14; ComponentLink4Description: https://datasheet.ciiva.com/46440/1868787-46440891.pdf?src-supplier=Element14; ComponentLink5URL: https://datasheet.ciiva.com/7746/1738695-7746239.pdf?src-supplier=Element14; ComponentLink5Description: https://datasheet.ciiva.com/7746/1738695-7746239.pdf?src-supplier=Element14; ComponentLink6URL: https://datasheet.ciiva.com/15189/getdatasheetpartid-409289-15189591.pdf?src-supplier=Verical; ComponentLink6Description: https://datasheet.ciiva.com/15189/getdatasheetpartid-409289-15189591.pdf?src-supplier=Verical; Supplier Part Number 1: 311-10.0KHRCT-ND; LCSC Part Number: C98220
R36 R42 = RC0603FR-072K2L: RES 2.2K OHM 1% 1/10W 0603; Manufacturer: Yageo; Resistance: 2.2kR; Temperature Coefficient: 100ppm/°C; Power Rating: 100mW; Voltage Rating: 50V; Item Type: Resistor; Supplier 1: Avnet; Manufacturer Part Number: RC0603FR-072K2L; RoHS: Yes; Category: Chip SMD Resistors; Stock 1: 733100; Pricing 1: 5000=0.00133, 10000=0.00131, 20000=0.00127 (USD); Case/Package: 0603; Case Code (Imperial): 0603; Case Code (Metric): 1608; Size Code: 0603; Min Operating Temperature: -55°C; Max Operating Temperature: 155°C; Tolerance: 1%; Packaging: Tape and Reel; Resistor Type: Thick Film; Package Quantity: 1; Termination: SMD/SMT; Number of Terminations: 2; Max Power Dissipation: 100mW; Features: Moisture Resistant; Series: RC; Resistance Tolerance: 1%; Construction: Rectangular; Length: 1.6mm; Width: 0.031inch; Height: 0.022inch; Depth: 0.8mm; Lead Free: Lead Free; Military Standard: Not; RoHS Compliant: Yes; Supplier Part Number 1: RC0603FR-072K2L; LCSC Part Number: C114662
R37 = RT0603BRD077K5L: RES SMD 7.5K OHM 0.1% 1/10W 0603; Manufacturer: Yageo; Resistance: 7.5kR; Power Rating: 100mW; Voltage Rating: 75V; Temperature Coefficient: 25ppm/°C; Voltage Rating (DC): 50V; Item Type: Resistor; Supplier 1: Avnet; Manufacturer Part Number: RT0603BRD077K5L; RoHS: Yes; Category: Chip SMD Resistors; Stock 1: 30000; Pricing 1: 5000=0.02327, 10000=0.02294, 20000=0.02227 (USD); Case/Package: 0603; Case Code (Imperial): 0603; Case Code (Metric): 1608; Weight: 7.1E-05oz; Contact Plating: Tin,Matte; Size Code: 0603; Min Operating Temperature: -55°C; Max Operating Temperature: 125°C; Package Quantity: 5000; Packaging: Tape and Reel; Tolerance: 0.1%; Resistor Type: Thin Film; Termination: SMD/SMT; Number of Terminations: 2; Max Power Dissipation: 100mW; Features: Moisture Resistant; Series: RT; Length: 0.063inch; Width: 0.8mm; Height: 0.022inch; Radiation Hardening: No; Lead Free: Lead Free; RoHS Compliant: Yes; ComponentLink1URL: https://datasheet.ciiva.com/8891/pyu-rt-1-to-0-05-rohs-l-4-8891914.pdf?src-supplier=Avnet; ComponentLink1Description: https://datasheet.ciiva.com/8891/pyu-rt-1-to-0-05-rohs-l-4-8891914.pdf?src-supplier=Avnet; Supplier Part Number 1: RT0603BRD077K5L; LCSC Part Number: C728597
R38 = RC0603DR-073K3L: as R13 on sheet Controller_Section; Supplier 1: Avnet; Manufacturer Part Number: RC0603DR-073K3L; RoHS: Yes; Category: Chip SMD Resistors; Pricing 1: 5000=0.00430, 10000=0.00424, 20000=0.00411 (USD); Case/Package: 0603; Min Operating Temperature: -55°C; Max Operating Temperature: 155°C; Packaging: Tape and Reel; Resistor Type: Thick Film; Number of Terminations: 2; Tolerance: 0.5%; Features: Moisture Resistant; Length: 0.063inch; Width: 0.031inch; Height: 0.022inch; RoHS Compliant: Yes; ComponentLink1URL: http://www.yageo.com.tw/exep/pages/download/literatures/PYu-R_INT-thick_7.pdf?src-supplier=Digi-Key; ComponentLink1Description: http://www.yageo.com.tw/exep/pages/download/literatures/PYu-R_INT-thick_7.pdf?src-supplier=Digi-Key; Supplier Part Number 1: RC0603DR-073K3L; LCSC Part Number: C723574
R71 R72 R76-R78 R81-R88 = RC0603JR-070RL: as R134 on sheet WIFI_Display_Sheet; Supplier 1: Digi-Key; Manufacturer Part Number: RC0603JR-070RL; RoHS: Yes; Category: Chip SMD Resistors; Stock 1: 18081776; Pricing 1: 1=0.10000, 10=0.01700, 25=0.01240, 50=0.00960, 100=0.00700, 250=0.00536, 500=0.00430, 1000=0.00316 (USD); Case/Package: 0603; Number of Pins: 2; Contact Plating: Tin,Matte; Case Code (Imperial): 0603; Case Code (Metric): 1608; Size Code: 0603; Min Operating Temperature: -55°C; Max Operating Temperature: 155°C; Resistor Type: Thick Film; Packaging: Tape and Reel; Termination: SMD/SMT; Series: RC; Technology: THICK FILM; Package Quantity: 5000; Voltage Rating: 50V; Features: Moisture Resistant; Max Power Dissipation: 100mW; Number of Terminations: 2; Construction: Rectangular; Length: 1.6mm; Width: 0.8mm; Height: 0.45mm; Depth: 0.8mm; Radiation Hardening: No; Reach SVHC Compliant: No SVHC; Lead Free: Lead Free; RoHS Compliant: Yes; Military Standard: Not; Supplier Part Number 1: 311-0.0GRCT-ND; LCSC Part Number: C95177
R119 R121 = RC1206JR-070RL: RES 0 OHM JUMPER 1/4W 1206; Manufacturer: Yageo; Item Type: Resistors; Value: 0mR; Tolerance: 5%; Power Rating: 250mW; Voltage Rating: 200V; Temperature Coefficient: 200ppm/°C; Supplier: Future Electronics; Supplier Part Number: 1414689; Manufacturer Part Number: RC1206JR-070RL; RoHS: Yes; Stock: 1115000; Pricing: 5000=0.0025, 15000=0.0039, 25000=0.0023, 50000=0.0037, 100000=0.0022, 200000=0.0035, 250000=0.0021, 625000=0.002 (USD); Case/Package: 1206; Contact Plating: Tin,Matte; Case Code (Metric): 3216; Case Code (Imperial): 1206; Min Operating Temperature: -55°C; Max Operating Temperature: 155°C; Resistor Type: Thick Film,Carbon Film; Packaging: Tape and Reel; Package Quantity: 1; Number of Terminations: 2; Termination: SMD/SMT; Max Power Dissipation: 250mW; Series: RC; Resistance Tolerance: 5%; Technology: THICK FILM; Features: Moisture Resistant; Length: 0.122inch; Width: 0.063inch; Height: 0.026inch; Depth: 1.6mm; RoHS Compliant: Yes; Reach SVHC Compliant: Unknown; Lead Free: 5697LeadFree; ComponentLink1URL: https://datasheet.ciiva.com/11808/0900766b80c6630a-11808156.pdf?src-supplier=Rs; ComponentLink1Description: https://datasheet.ciiva.com/11808/0900766b80c6630a-11808156.pdf?src-supplier=Rs; ComponentLink2URL: https://datasheet.ciiva.com/29181/402222-da-01-en-smd-widerstand-0-ohm-1206-29181568.pdf?src-supplier=Conrad; ComponentLink2Description: https://datasheet.ciiva.com/29181/402222-da-01-en-smd-widerstand-0-ohm-1206-29181568.pdf?src-supplier=Conrad; ComponentLink3URL: https://datasheet.ciiva.com/7983/444357-7983807.pdf?src-supplier=Element14; ComponentLink3Description: https://datasheet.ciiva.com/7983/444357-7983807.pdf?src-supplier=Element14; ComponentLink4URL: https://datasheet.ciiva.com/22747/1692832-22747541.pdf?src-supplier=Element14; ComponentLink4Description: https://datasheet.ciiva.com/22747/1692832-22747541.pdf?src-supplier=Element14; ComponentLink5URL: https://datasheet.ciiva.com/46445/444357-46445719.pdf?src-supplier=Element14; ComponentLink5Description: https://datasheet.ciiva.com/46445/444357-46445719.pdf?src-supplier=Element14; ComponentLink6URL: https://datasheet.ciiva.com/2458/pyu-rc1206-51-rohs-l-4-2458669.pdf?src-supplier=Digikey; ComponentLink6Description: https://datasheet.ciiva.com/2458/pyu-rc1206-51-rohs-l-4-2458669.pdf?src-supplier=Digikey; ComponentLink7URL: https://datasheet.ciiva.com/2458/pyu-rc1206-51-rohs-l-4-2458670.pdf?src-supplier=Digikey; ComponentLink7Description: https://datasheet.ciiva.com/2458/pyu-rc1206-51-rohs-l-4-2458670.pdf?src-supplier=Digikey; ComponentLink8URL: https://datasheet.ciiva.com/2458/pyu-rc1206-51-rohs-l-4-2458668.pdf?src-supplier=Digikey; ComponentLink8Description: https://datasheet.ciiva.com/2458/pyu-rc1206-51-rohs-l-4-2458668.pdf?src-supplier=Digikey; ComponentLink9URL: https://datasheet.ciiva.com/7857/1692832-7857422.pdf?src-supplier=Element14; ComponentLink9Description: https://datasheet.ciiva.com/7857/1692832-7857422.pdf?src-supplier=Element14; ComponentLink10URL: https://datasheet.ciiva.com/7857/1692832-7857421.pdf?src-supplier=Element14; ComponentLink10Description: https://datasheet.ciiva.com/7857/1692832-7857421.pdf?src-supplier=Element14; ComponentLink11URL: https://datasheet.ciiva.com/17035/pyu-rc1206-51-rohs-l-4-17035512.pdf?src-supplier=Future+Electronics; ComponentLink11Description: https://datasheet.ciiva.com/17035/pyu-rc1206-51-rohs-l-4-17035512.pdf?src-supplier=Future+Electronics
R138-R148 R150 = RC0402FR-074K7L: as R16 on sheet Controller_Section; Supplier 1: Avnet; Manufacturer Part Number: RC0402FR-074K7L; RoHS: Yes; Category: Chip SMD Resistors; Stock 1: 2420000; Pricing 1: 10000=0.00085 (USD); Case/Package: 0402; Number of Pins: 2; Case Code (Imperial): 0402; Case Code (Metric): 1005; Size Code: 0402; Min Operating Temperature: -55°C; Max Operating Temperature: 155°C; Tolerance: 1%; Voltage Rating: 50V; Packaging: Tape and Reel; Resistor Type: Thick Film; Termination: SMD/SMT; Features: Moisture Resistant; Series: RC; Number of Terminations: 2; Resistance Tolerance: 1%; Construction: Rectangular; Length: 1mm; Width: 0.5mm; Height: 0.32mm; Depth: 0.5mm; Height - Seated (Max): 0.016inch; RoHS Compliant: Yes; Reach SVHC Compliant: Yes; Military Standard: Not; Lead Free: Lead Free; ComponentLink1URL: https://datasheet.ciiva.com/22661/1686128-22661342.pdf?src-supplier=Element14; ComponentLink1Description: https://datasheet.ciiva.com/22661/1686128-22661342.pdf?src-supplier=Element14; ComponentLink2URL: https://datasheet.ciiva.com/7850/1018594-7850022.pdf?src-supplier=Element14; ComponentLink2Description: https://datasheet.ciiva.com/7850/1018594-7850022.pdf?src-supplier=Element14; ComponentLink3URL: https://datasheet.ciiva.com/7850/1018594-7850023.pdf?src-supplier=Element14; ComponentLink3Description: https://datasheet.ciiva.com/7850/1018594-7850023.pdf?src-supplier=Element14; ComponentLink4URL: https://datasheet.ciiva.com/15215/getdatasheetpartid-328119-15215035.pdf?src-supplier=Verical; ComponentLink4Description: https://datasheet.ciiva.com/15215/getdatasheetpartid-328119-15215035.pdf?src-supplier=Verical; Supplier Part Number 1: RC0402FR-074K7L; LCSC Part Number: C105871
R175 = RC0402FR-071ML: RES 1M OHM 1% 1/16W 0402; Manufacturer: Yageo; Value: 1MR; Power Rating: 63mW; Voltage Rating: 50V; Temperature Coefficient: 100ppm/°C; Item Type: Resistor; Supplier: Digikey; Supplier Part Number: 311-1.00MLRCT-ND; Manufacturer Part Number: RC0402FR-071ML; RoHS: Yes; Category: Chip SMD Resistors; Stock: 6516; Pricing: 1=0.1, 10=0.015, 50=0.0088, 100=0.0073, 500=0.00488, 1000=0.00417, 5000=0.00297 (USD); Case/Package: 0402; Case Code (Imperial): 0402; Case Code (Metric): 1005; Min Operating Temperature: -55°C; Max Operating Temperature: 155°C; Resistor Type: Thick Film; Packaging: Tape and Reel; Tolerance: 1%; Termination: SMD/SMT; Features: Moisture Resistant; Series: RC; Max Power Dissipation: 63mW; Number of Terminations: 2; Resistance Tolerance: 1%; Construction: Rectangular; Technology: THICK FILM; Voltage Rating (AC): 50V; Length: 1mm; Height: 0.32mm; Depth: 0.5mm; RoHS Compliant: Yes; Military Standard: Not; Reach SVHC Compliant: Unknown; Lead Free: 5697LeadFree; ComponentLink1URL: https://datasheet.ciiva.com/11808/0900766b80c66297-11808125.pdf?src-supplier=Rs; ComponentLink1Description: https://datasheet.ciiva.com/11808/0900766b80c66297-11808125.pdf?src-supplier=Rs; ComponentLink2URL: https://datasheet.ciiva.com/46394/1018594-46394951.pdf?src-supplier=Element14; ComponentLink2Description: https://datasheet.ciiva.com/46394/1018594-46394951.pdf?src-supplier=Element14; ComponentLink3URL: https://datasheet.ciiva.com/7849/1018594-7849883.pdf?src-supplier=Element14; ComponentLink3Description: https://datasheet.ciiva.com/7849/1018594-7849883.pdf?src-supplier=Element14; ComponentLink4URL: https://datasheet.ciiva.com/7849/1018594-7849882.pdf?src-supplier=Element14; ComponentLink4Description: https://datasheet.ciiva.com/7849/1018594-7849882.pdf?src-supplier=Element14; ComponentLink5URL: https://datasheet.ciiva.com/16741/pyu-rc0402-51-rohs-l-6-r-16741081.pdf?src-supplier=Future+Electronics; ComponentLink5Description: https://datasheet.ciiva.com/16741/pyu-rc0402-51-rohs-l-6-r-16741081.pdf?src-supplier=Future+Electronics; LCSC Part Number: C138033
R178-R180 R187 R189 = RC0402FR-075K1L: RES 5.1K OHM 1% 1/16W 0402; Manufacturer: Yageo; Power Rating: 63mW; Resistance: 5.1kR; Temperature Coefficient: 100ppm/°C; Voltage Rating: 50V; Item Type: Resistor; Supplier 1: Avnet; Manufacturer Part Number: RC0402FR-075K1L; RoHS: Yes; Category: Chip SMD Resistors; Stock 1: 65000; Pricing 1: 10000=0.00085 (USD); Case/Package: 0402; Case Code (Metric): 1005; Case Code (Imperial): 0402; Min Operating Temperature: -55°C; Max Operating Temperature: 155°C; Tolerance: 1%; Technology: THICK FILM; Packaging: Tape and Reel; Package Quantity: 1; Resistor Type: Thick Film; Number of Terminations: 2; Termination: SMD/SMT; Max Power Dissipation: 63mW; Voltage Rating (DC): 50V; Working Voltage: 50V; Features: Moisture Resistant; Series: RC; Resistance Tolerance: 1%; Construction: Rectangular; Length: 1mm; Width: 0.02inch; Height: 0.016inch; Depth: 0.5mm; RoHS Compliant: Yes; Military Standard: Not; Lead Free: Lead Free; ComponentLink1URL: https://datasheet.ciiva.com/7983/1018594-7983519.pdf?src-supplier=Element14; ComponentLink1Description: https://datasheet.ciiva.com/7983/1018594-7983519.pdf?src-supplier=Element14; ComponentLink2URL: https://datasheet.ciiva.com/46394/1018594-46394936.pdf?src-supplier=Element14; ComponentLink2Description: https://datasheet.ciiva.com/46394/1018594-46394936.pdf?src-supplier=Element14; ComponentLink3URL: https://datasheet.ciiva.com/2453/pyu-r-int-thick-7-2453401.pdf?src-supplier=Digi-Key; ComponentLink3Description: https://datasheet.ciiva.com/2453/pyu-r-int-thick-7-2453401.pdf?src-supplier=Digi-Key; ComponentLink4URL: https://datasheet.ciiva.com/2453/pyu-r-int-thick-7-2453402.pdf?src-supplier=Digi-Key; ComponentLink4Description: https://datasheet.ciiva.com/2453/pyu-r-int-thick-7-2453402.pdf?src-supplier=Digi-Key; ComponentLink5URL: https://datasheet.ciiva.com/2453/pyu-r-int-thick-7-2453400.pdf?src-supplier=Digi-Key; ComponentLink5Description: https://datasheet.ciiva.com/2453/pyu-r-int-thick-7-2453400.pdf?src-supplier=Digi-Key; ComponentLink6URL: https://datasheet.ciiva.com/12558/pyu-rc0402-51-rohs-l-6-r-8721-12558460.pdf?src-supplier=Mouser; ComponentLink6Description: https://datasheet.ciiva.com/12558/pyu-rc0402-51-rohs-l-6-r-8721-12558460.pdf?src-supplier=Mouser; ComponentLink7URL: https://datasheet.ciiva.com/16744/pyu-rc0402-51-rohs-l-6-r-16744283.pdf?src-supplier=Future+Electronics; ComponentLink7Description: https://datasheet.ciiva.com/16744/pyu-rc0402-51-rohs-l-6-r-16744283.pdf?src-supplier=Future+Electronics; ComponentLink8URL: https://datasheet.ciiva.com/15189/getdatasheetpartid-323636-15189493.pdf?src-supplier=Verical; ComponentLink8Description: https://datasheet.ciiva.com/15189/getdatasheetpartid-323636-15189493.pdf?src-supplier=Verical; Supplier Part Number 1: RC0402FR-075K1L; LCSC Part Number: C105872
R188 R190 R198 R200-R202 R210 R212 R213 = RC0402FR-0710KL: as R105 on sheet Controller_Section; Supplier 1: Mouser; Manufacturer Part Number: RC0402FR-0710KL; RoHS: Yes; Category: Chip SMD Resistors; Stock 1: 18648329; Pricing 1: 1=0.10000, 10=0.01400, 50=0.01400, 100=0.00500, 1000=0.00300, 10000=0.00200 (USD); Case/Package: 0402; Number of Pins: 2; Case Code (Imperial): 0402; Case Code (Metric): 1005; Min Operating Temperature: -55°C; Max Operating Temperature: 155°C; Resistor Type: Thick Film; Tolerance: 1%; Packaging: Tape and Reel; Voltage Rating: 50V; Termination: SMD/SMT; Working Voltage: 50V; Number of Terminations: 2; Features: Moisture Resistant; Series: RC; Resistance Tolerance: 1%; Construction: Rectangular; Length: 1mm; Width: 0.5mm; Height: 0.32mm; Depth: 0.5mm; Lead Pitch: 0.2mm; REACH SVHC: No SVHC; Lead Free: Lead Free; RoHS Compliant: Yes; Military Standard: Not; ComponentLink1URL: https://datasheet.ciiva.com/7660/38568-7660787.pdf?src-supplier=Element14; ComponentLink1Description: https://datasheet.ciiva.com/7660/38568-7660787.pdf?src-supplier=Element14; ComponentLink2URL: https://datasheet.ciiva.com/7849/1686128-7849814.pdf?src-supplier=Element14; ComponentLink2Description: https://datasheet.ciiva.com/7849/1686128-7849814.pdf?src-supplier=Element14; ComponentLink3URL: https://datasheet.ciiva.com/7983/1018594-7983486.pdf?src-supplier=Element14; ComponentLink3Description: https://datasheet.ciiva.com/7983/1018594-7983486.pdf?src-supplier=Element14; ComponentLink4URL: https://datasheet.ciiva.com/22747/1018594-22747512.pdf?src-supplier=Element14; ComponentLink4Description: https://datasheet.ciiva.com/22747/1018594-22747512.pdf?src-supplier=Element14; ComponentLink5URL: https://datasheet.ciiva.com/12667/pyu-rc0402-51-rohs-l-6-r-12667067.pdf?src-supplier=Mouser; ComponentLink5Description: https://datasheet.ciiva.com/12667/pyu-rc0402-51-rohs-l-6-r-12667067.pdf?src-supplier=Mouser; ComponentLink6URL: https://datasheet.ciiva.com/7849/1784430-7849813.pdf?src-supplier=Element14; ComponentLink6Description: https://datasheet.ciiva.com/7849/1784430-7849813.pdf?src-supplier=Element14; ComponentLink7URL: https://datasheet.ciiva.com/7849/1784430-7849815.pdf?src-supplier=Element14; ComponentLink7Description: https://datasheet.ciiva.com/7849/1784430-7849815.pdf?src-supplier=Element14; Supplier Part Number 1: 603-RC0402FR-0710KL; LCSC Part Number: C60490
R192 R194 R204 R206 = RC0402FR-070RL: as R55 on sheet Controller_Section; Supplier 1: Mouser; Manufacturer Part Number: RC0402FR-070RL; RoHS: Yes; Stock 1: 8556842; Pricing 1: 1=0.10000, 10=0.01400, 50=0.01400, 100=0.00600, 1000=0.00300, 5000=0.00200, 10000=0.00100 (USD); Mount: Surface Mount; Case/Package: 0402; Contact Plating: Tin,Matte; Case Code (Imperial): 0402; Case Code (Metric): 1005; Size Code: 0402; Min Operating Temperature: -55°C; Max Operating Temperature: 155°C; Resistance: 0R; Resistor Type: Thick Film; Packaging: Tape and Reel; Termination: SMD/SMT; Features: Moisture Resistant; Series: RC; Number of Terminations: 2; Length: 1mm; Width: 0.5mm; Height: 0.35mm; Radiation Hardening: No; Lead Free: Lead Free; RoHS Compliant: Yes; ComponentLink1URL: https://datasheet.ciiva.com/8896/pyu-rc0402-51-rohs-l-6-8896149.pdf?src-supplier=Avnet; ComponentLink1Description: https://datasheet.ciiva.com/8896/pyu-rc0402-51-rohs-l-6-8896149.pdf?src-supplier=Avnet; ComponentLink2URL: https://datasheet.ciiva.com/16790/pyu-rc0402-51-rohs-l-6-r-16790444.pdf?src-supplier=Future+Electronics; ComponentLink2Description: https://datasheet.ciiva.com/16790/pyu-rc0402-51-rohs-l-6-r-16790444.pdf?src-supplier=Future+Electronics; Supplier Part Number 1: 603-RC0402FR-070RL; LCSC Part Number: C106231
R196 R208 = RC0603FR-07120RL: RES 120 OHM 1% 1/10W 0603; Manufacturer: Yageo; Temperature Coefficient: 100ppm/°C; Voltage Rating (DC): 50V; Power Rating: 100mW; Item Type: Resistor; Supplier 1: Digi-Key; Manufacturer Part Number: RC0603FR-07120RL; RoHS: Yes; Category: Chip SMD Resistors; Stock 1: 839061; Pricing 1: 1=0.10000, 10=0.02400, 100=0.00970, 1000=0.00436, 2500=0.00378 (USD); Case/Package: 0603; Number of Pins: 2; Case Code (Metric): 1608; Case Code (Imperial): 0603; Size Code: 0603; Min Operating Temperature: -55°C; Max Operating Temperature: 155°C; Resistance: 120R; Tolerance: 1%; Resistor Type: Thick Film; Packaging: Tape and Reel; Voltage Rating: 50V; Package Quantity: 1; Number of Terminations: 2; Termination: SMD/SMT; Max Power Dissipation: 100mW; Features: Moisture Resistant; Series: RC; Construction: Rectangular; Resistance Tolerance: 1%; Length: 1.6mm; Width: 0.031inch; Height: 0.022inch; Depth: 0.8mm; REACH SVHC: No SVHC; Lead Free: Lead Free; Military Standard: Not; RoHS Compliant: Yes; ComponentLink1URL: https://datasheet.ciiva.com/2553/pyu-r-int-thick-7-2553512.pdf?src-supplier=Digi-Key; ComponentLink1Description: https://datasheet.ciiva.com/2553/pyu-r-int-thick-7-2553512.pdf?src-supplier=Digi-Key; ComponentLink2URL: https://datasheet.ciiva.com/7746/443971-7746248.pdf?src-supplier=Element14; ComponentLink2Description: https://datasheet.ciiva.com/7746/443971-7746248.pdf?src-supplier=Element14; ComponentLink3URL: https://datasheet.ciiva.com/2553/pyu-r-int-thick-7-2553513.pdf?src-supplier=Digi-Key; ComponentLink3Description: https://datasheet.ciiva.com/2553/pyu-r-int-thick-7-2553513.pdf?src-supplier=Digi-Key; ComponentLink4URL: https://datasheet.ciiva.com/7746/443971-7746249.pdf?src-supplier=Element14; ComponentLink4Description: https://datasheet.ciiva.com/7746/443971-7746249.pdf?src-supplier=Element14; ComponentLink5URL: https://datasheet.ciiva.com/2553/pyu-r-int-thick-7-2553514.pdf?src-supplier=Digi-Key; ComponentLink5Description: https://datasheet.ciiva.com/2553/pyu-r-int-thick-7-2553514.pdf?src-supplier=Digi-Key; ComponentLink6URL: https://datasheet.ciiva.com/46395/443971-46395021.pdf?src-supplier=Element14; ComponentLink6Description: https://datasheet.ciiva.com/46395/443971-46395021.pdf?src-supplier=Element14; Supplier Part Number 1: 311-120HRCT-ND; LCSC Part Number: C114640
SB2-SB5 = Solder Bridge 0603: Solder Bridge ON; Manufacturer Part Number: Solder Bridge; Item Type: Solder Bridge
U32 = WK2124-ISSG: WK2124 SPI Bus Interface Wide Operating Voltage 4-Channel 256-Level FIFO High-Speed UART; Manufacturer: WEIKAI; Item Type: IC; Manufacturer Part Number: WK2124-ISSG; Package: SSOP-20-208mil; LCSC Part Number: C86332; ComponentLink1Description: LCSC; ComponentLink1URL: https://www.lcsc.com/product-detail/Interface-Specialized_WEIKAI-WK2124-ISSG_C86332.html?s_z=n_wk2124
U33 U35 = SP3485EIM/TR: SOP-8 RS-485/RS-422 ICs ROHS; Manufacturer: HGSEMI; Item Type: IC; Manufacturer Part Number: SP3485EIM/TR; Package: SOP-8; LCSC Part Number: C519086; ComponentLink1Description: LCSC; ComponentLink1URL: https://www.lcsc.com/product-detail/RS-485-RS-422-ICs_HGSEMI-SP3485EIM-TR_C519086.html
X2 = SX3B14.7456F2010F30: 14.7456MHz Surface Mount Crystal 20pF ±10ppm ±30ppm SMD3225-4P Crystals ROHS; Manufacturer: Shenzhen SCTF Elec; Supplier: LCSC; LCSC Part Number: C2901666; Manufacturer Part Number: SX3B14.7456F2010F30; RoHS: No; Item Type: Crystal; Stock: 2580; Pricing: 5=0.0774, 50=0.0625, 150=0.0551, 500=0.0495, 3000=0.0447, 6000=0.0425 (USD)